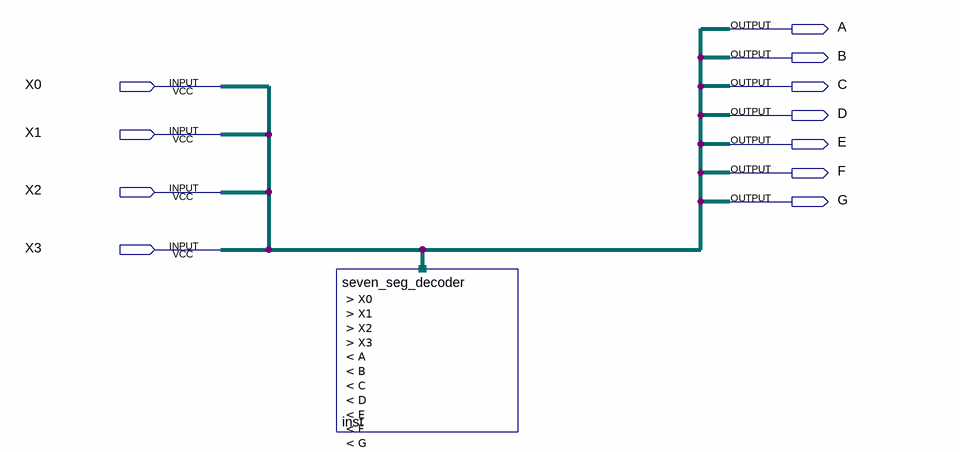
[diagram p0: schematic sheet]
// Quartus schematic seven_seg_decoder.bdf as structural Verilog: 1 symbols, 11 pins
module seven_seg_decoder (
  input  X0,
  input  X1,
  input  X2,
  input  X3,
  output A,
  output B,
  output C,
  output D,
  output E,
  output F,
  output G
);

  seven_seg_decoder inst (.X0(X0), .X1(X1), .X2(X2), .X3(X3), .A(A), .B(B), .C(C), .D(D), .E(E), .F(F), .G(G));
endmodule
